# Altium project Programmable_Current_Load.PrjPcb (part 1 of 2)
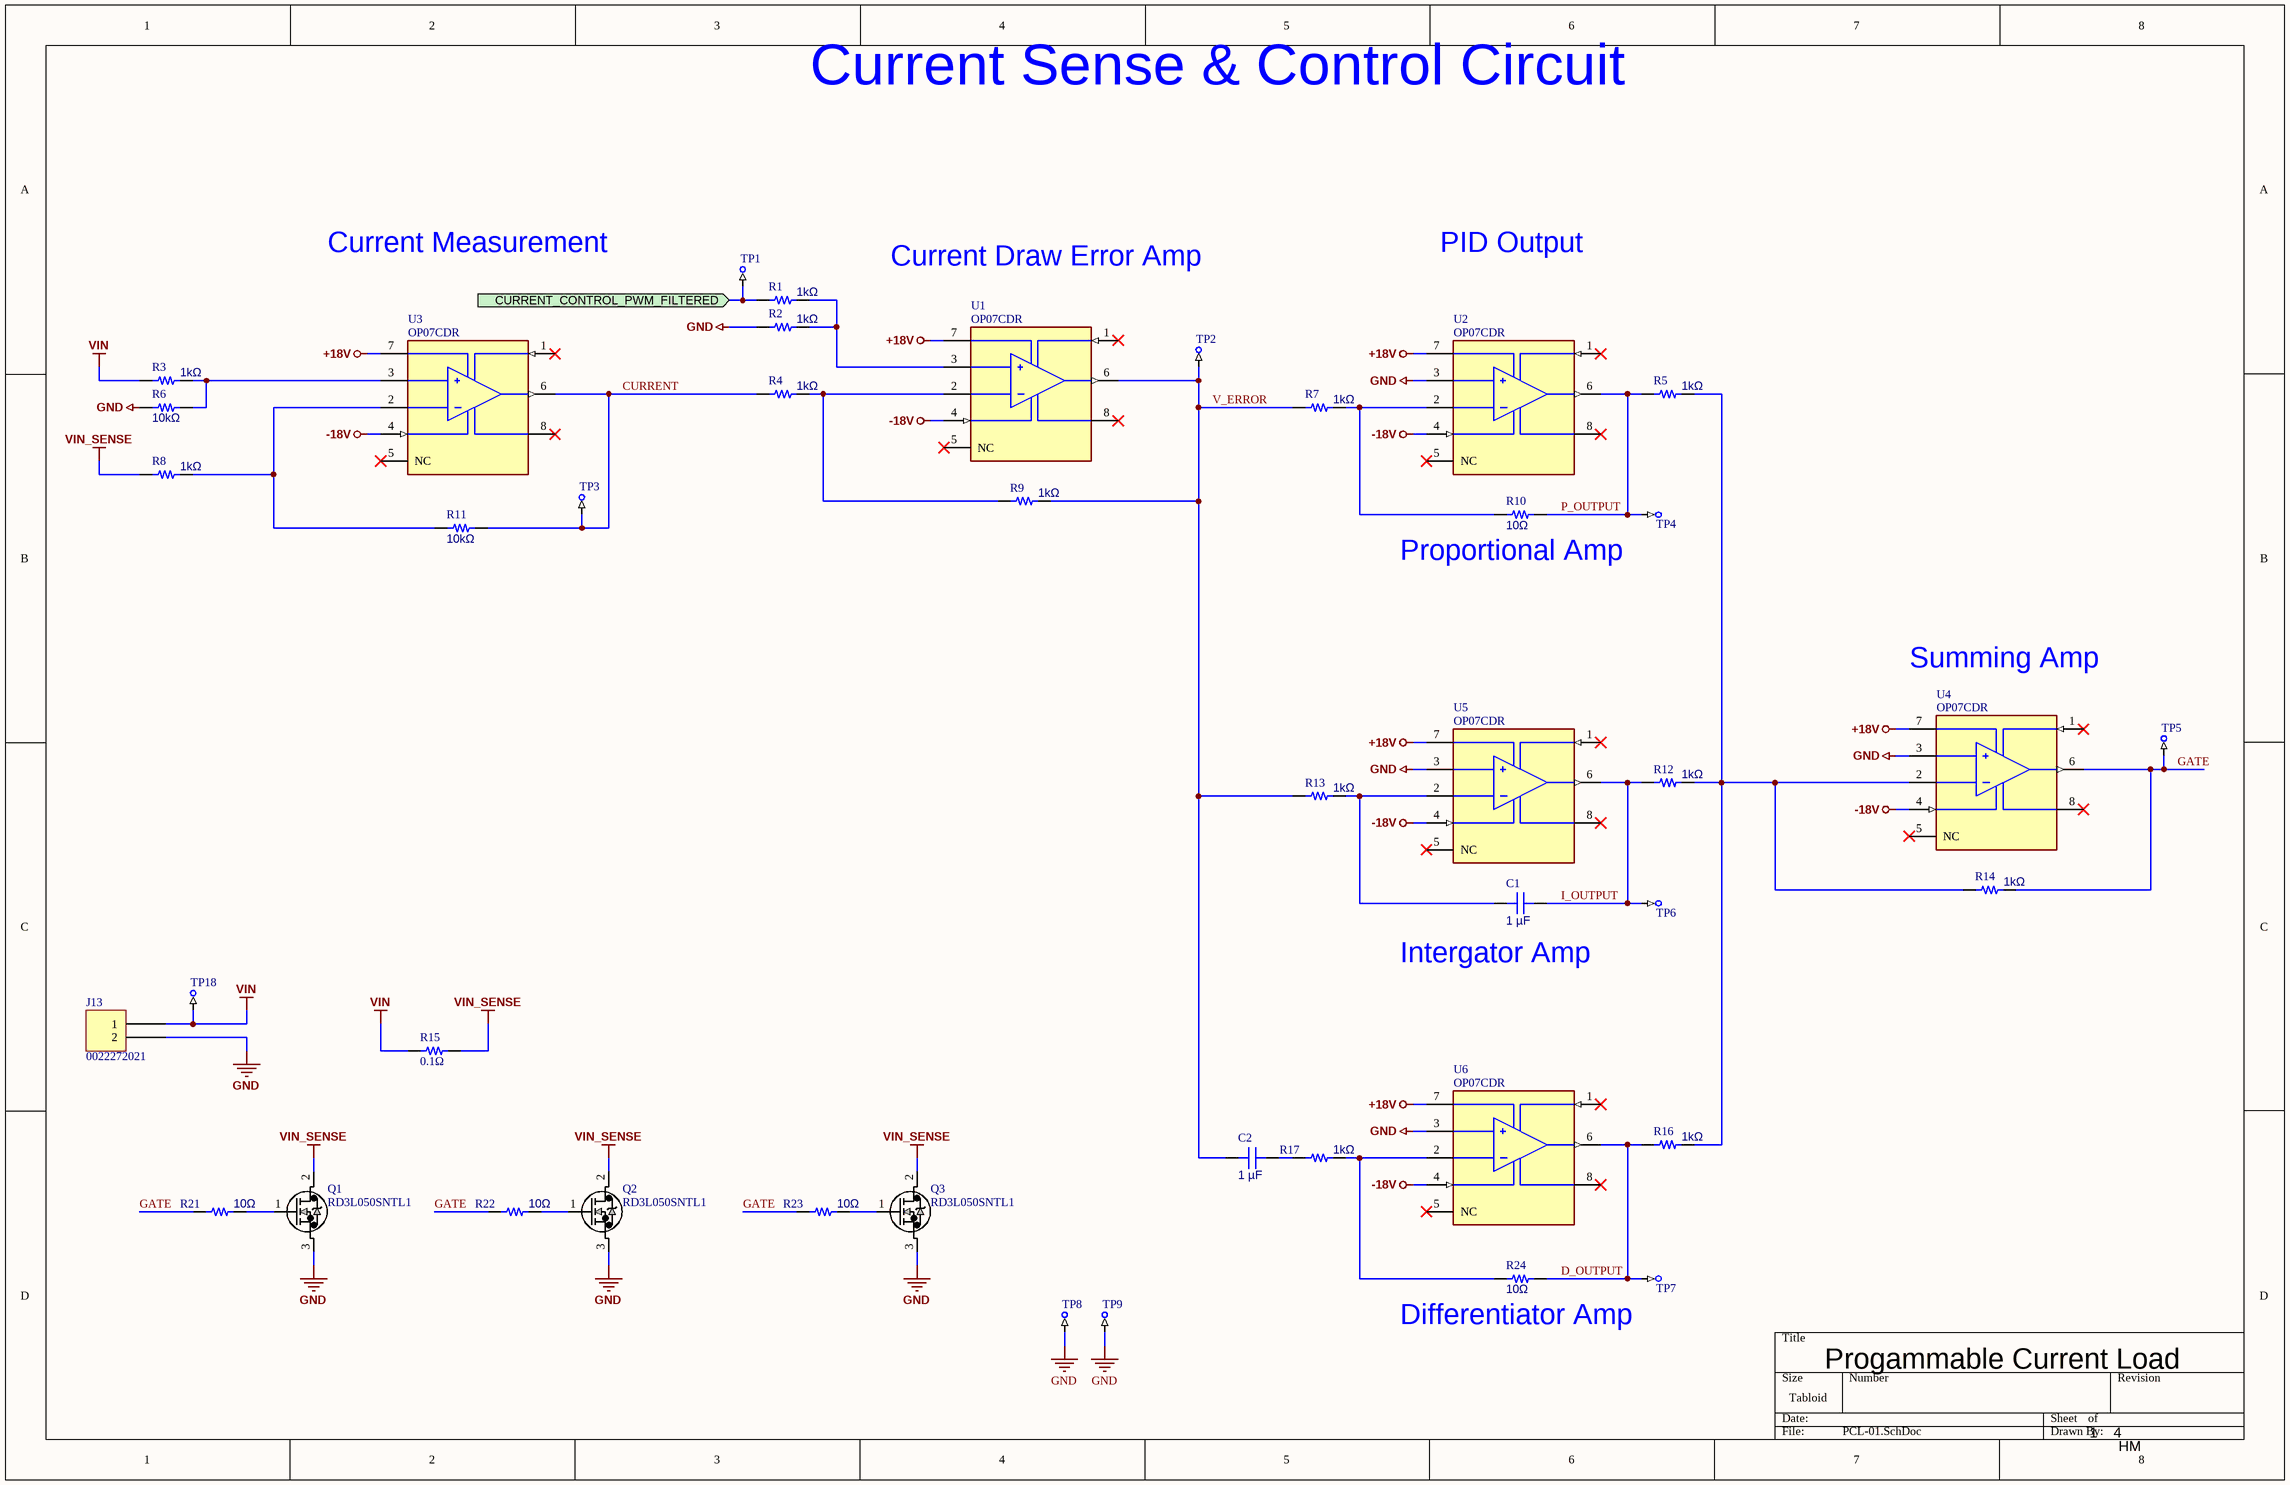
[diagram p0: PCL-01.SchDoc]
4 sheets, 153 parts. Net scope: flat (ports and power ports of the same name join across sheets).
Board file: PCL.PcbDoc
Sheets:
  PCL-01.SchDoc
  PCL-02.SchDoc
  PCL-03.SchDoc
  PCL-04.SchDoc

## Sheet PCL-01.SchDoc
size Tabloid; SheetNumber: 1; SheetTotal: 4

### Parts
C1  1 µF  [CAP 0805_2012]
C2  1 µF  [CAP 0805_2012]
J13  0022272021  [MOLEX KK 0022272021]
Q1  RD3L050SNTL1  [TRANS_RD3H045S_ROM]
Q2  RD3L050SNTL1  [TRANS_RD3H045S_ROM]
Q3  RD3L050SNTL1  [TRANS_RD3H045S_ROM]
R1  1kΩ  [RES 0805_2012]
R2  1kΩ  [RES 0805_2012]
R3  1kΩ  [RES 0805_2012]
R4  1kΩ  [RES 0805_2012]
R5  1kΩ  [RES 0805_2012]
R6  10kΩ  [RES 0805_2012]
R7  1kΩ  [RES 0805_2012]
R8  1kΩ  [RES 0805_2012]
R9  1kΩ  [RES 0805_2012]
R10  10Ω  [RES 0805_2012]
R11  10kΩ  [RES 0805_2012]
R12  1kΩ  [RES 0805_2012]
R13  1kΩ  [RES 0805_2012]
R14  1kΩ  [RES 0805_2012]
R15  0.1Ω  [RES 2512_6432]
R16  1kΩ  [RES 0805_2012]
R17  1kΩ  [RES 0805_2012]
R21  10Ω  [RES 0603_1608]
R22  10Ω  [RES 0603_1608]
R23  10Ω  [RES 0603_1608]
R24  10Ω  [RES 0805_2012]
TP1  5016  [KEYSTONE-5016_V]  (value not drawn)
TP2  5016  [KEYSTONE-5016_V]  (value not drawn)
TP3  5016  [KEYSTONE-5016_V]  (value not drawn)
TP4  5016  [KEYSTONE-5016_V]  (value not drawn)
TP5  5016  [KEYSTONE-5016_V]  (value not drawn)
TP6  5016  [KEYSTONE-5016_V]  (value not drawn)
TP7  5016  [KEYSTONE-5016_V]  (value not drawn)
TP8  5016  [KEYSTONE-5016_V]  (value not drawn)
TP9  5016  [KEYSTONE-5016_V]  (value not drawn)
TP18  5016  [KEYSTONE-5016_V]  (value not drawn)
U1  OP07CDR  [FP-D0008A-MFG]
U2  OP07CDR  [FP-D0008A-MFG]
U3  OP07CDR  [FP-D0008A-MFG]
U4  OP07CDR  [FP-D0008A-MFG]
U5  OP07CDR  [FP-D0008A-MFG]
U6  OP07CDR  [FP-D0008A-MFG]

### Ports
CURRENT_CONTROL_PWM_FILTERED (in, see PCL-02[5D])

### Nets
+18V: U1.7(VCC+) U2.7(VCC+) U3.7(VCC+) U4.7(VCC+) U5.7(VCC+) U6.7(VCC+)
-18V: U1.4(VCC-) U2.4(VCC-) U3.4(VCC-) U4.4(VCC-) U5.4(VCC-) U6.4(VCC-)
GND: J13.2 Q1.3 Q2.3 Q3.3 R2.1 R6.1 TP8.1 TP9.1 U2.3(IN+) U4.3(IN+) U5.3(IN+) U6.3(IN+)
VIN: J13.1 R3.1 R15.2 TP18.1
VIN_SENSE: Q1.2 Q2.2 Q3.2 R8.1 R15.1
CURRENT: R4.1 R11.2 TP3.1 U3.6(OUT)
D_OUTPUT: R16.1 R24.2 TP7.1 U6.6(OUT)
GATE: R14.2 R21.1 R22.1 R23.1 TP5.1 U4.6(OUT)
I_OUTPUT: C1.2 R12.1 TP6.1 U5.6(OUT)
P_OUTPUT: R5.1 R10.2 TP4.1 U2.6(OUT)
V_ERROR: C2.1 R7.1 R9.2 R13.1 TP2.1 U1.6(OUT)
NetC1_1: C1.1 R13.2 U5.2(IN-)
NetC2_2: C2.2 R17.1
NetQ1_1: Q1.1 R21.2
NetQ2_1: Q2.1 R22.2
NetQ3_1: Q3.1 R23.2
NetR1_1: R1.1 TP1.1 ; port CURRENT_CONTROL_PWM_FILTERED
NetR1_2: R1.2 R2.2 U1.3(IN+)
NetR3_2: R3.2 R6.2 U3.3(IN+)
NetR4_2: R4.2 R9.1 U1.2(IN-)
NetR5_2: R5.2 R12.2 R14.1 R16.2 U4.2(IN-)
NetR7_2: R7.2 R10.1 U2.2(IN-)
NetR8_2: R8.2 R11.1 U3.2(IN-)
NetR17_2: R17.2 R24.1 U6.2(IN-)

Not connected (* = marked no-connect by the designer): U1 1(OFFSET_N1)* 5(NC)* 8*; U2 1(OFFSET_N1)* 5(NC)* 8*; U3 1(OFFSET_N1)* 5(NC)* 8*; U4 1(OFFSET_N1)* 5(NC)* 8*; U5 1(OFFSET_N1)* 5(NC)* 8*; U6 1(OFFSET_N1)* 5(NC)* 8*

### Notes on the sheet
- Current Sense & Control Circuit
- Current Measurement
- Current Draw Error Amp
- PID Output
- Proportional Amp
- Summing Amp
- (near C1) Intergator Amp
- Differentiator Amp
- Progammable Current Load
- 1
- 4
- HM

### Library data of the parts
C1 C2 = 0805X105K500CT: CAP CER 1UF 50V X5R 0805; manufacturer: Walsin Technology Corporation; Tolerance: ±10%; Part Number: 0805X105K500CT; Capacitance: 1 µF; Applications: General Purpose; componentlink1description: Datasheet; componentlink1url: https://www.passivecomponent.com/wp-content/uploads/datasheet/WTC_MLCC_General_Purpose.pdf; componentlink2description: DigiKey Link; componentlink2url: https://www.digikey.com/en/products/detail/walsin-technology-corporation/0805X105K500CT/15978747; Device Package: 0805 (2012 Metric); lastupdated: 2026-04-06 7:30:03 PM; Lifecycle Status: Active; Minimum Order: 1; Mounting Type: Surface Mount, MLCC; Operating Temperature: -55°C ~ 85°C; Package / Case: 0805 (2012 Metric); packaging: TapeAndReel; partid: 55928; price: 0.01; series: -; Size / Dimension: 0.079" L x 0.049" W (2.00mm x 1.25mm); Supplier 1: DigiKey; Supplier Part Number 1: 1292-0805X105K500CT-ND; Temperature Coefficient: X5R; Thickness (Max): 0.057" (1.45mm); value: 1 µF; Voltage - Rated: 50V
J13 = 0022272021: CONN HEADER VERT 2POS 2.54MM; Manufacturer: Molex; Contact Length - Mating: 0.295" (7.49mm); Contact Length - Post: 0.140" (3.56mm); Material Flammability Rating: UL94 V-0; Number of Positions: 2; Number of Positions Loaded: All; Overall Contact Length: 0.560" (14.22mm); Pitch - Mating: 0.100" (2.54mm); Shrouding: Shrouded - 1 Wall; Style: Board to Cable/Wire; Part Number: 0022272021; ComponentLink1Description: Datasheet; ComponentLink1URL: https://www.molex.com/pdm_docs/sd/022272021_sd.pdf; ComponentLink2Description: DigiKey Link; ComponentLink2URL: http://digikey.com/product-detail/en/molex/0022272021/WM4111-ND/1130577; Connector Type: Header; Contact Finish - Mating: Tin; Contact Finish - Post: Tin; Contact Finish Thickness - Mating: 100.0µin (2.54µm); Contact Material: Brass; Contact Shape: Square; Contact Type: Male Pin; Fastening Type: Friction Lock; Insulation Color: Natural; Insulation Height: 0.461" (11.70mm); Insulation Material: Polyamide (PA), Nylon; LastUpdated: 2020-01-12 11:51:43 PM; Lifecycle Status: Active; Minimum Order: 1; Mounting Type: Through Hole; Number of Rows: 1; Packaging: Bulk; PartId: 76; Part Status: Active; Price: 0.27; Series: KK 6410; Supplier 1: DigiKey; Supplier Part Number 1: WM4111-ND; Termination: Solder
Q1-Q3 = RD3L050SNTL1: Description; Manufacturer_Name: ROHM Semiconductor; Copyright: Copyright (C) 2026 Ultra Librarian. All rights reserved.; Manufacturer_Part_Number: RD3L050SNTL1
R1-R5 R7-R9 R12-R14 R16 R17 = 1-2176092-8: RES SMD 1K OHM 0.1% 1/4W 0805; Manufacturer: TE Connectivity Passive Product; Power (Watts): 0.25W, 1/4W; Resistance: 1 kOhms; Temperature Coefficient: ±25ppm/°C; Part Number: 1-2176092-8; Value: 1kΩ; ComponentLink1Description: Datasheet; ComponentLink1URL: https://www.te.com/commerce/DocumentDelivery/DDEController?Action=srchrtrv&DocNm=1773272&DocType=DS&DocLang=English; ComponentLink2Description: DigiKey Link; ComponentLink2URL: https://www.digikey.com/en/products/detail/te-connectivity-passive-product/1-2176092-8/4034011; Composition: Thin Film; Device Package: 0805 (2012 Metric); Height - Seated (Max): 0.026" (0.65mm); LastUpdated: 2026-04-05 8:11:23 PM; Lifecycle Status: Active; Minimum Order: 1; Number of Terminations: 2; Operating Temperature: -55°C ~ 155°C; Package / Case: 0805 (2012 Metric); Packaging: TapeAndReel; PartId: 28484; Part Status: Active; Price: 0.13; Series: RP73P, Holsworthy; Size / Dimension: 0.079" L x 0.049" W (2.00mm x 1.25mm); Supplier 1: DigiKey; Supplier Part Number 1: A110543CT-ND; Supplier Device Package: 0805; Tolerance: ±0.1%
R6 R11 = RNCS0805BKE10K0: RES 10K OHM 0.1% 1/10W 0805; Manufacturer: Stackpole Electronics Inc; Power (Watts): 0.1W, 1/10W; Resistance: 10 kOhms; Temperature Coefficient: ±25ppm/°C; Part Number: RNCS0805BKE10K0; Value: 10kΩ; ComponentLink1Description: Datasheet; ComponentLink1URL: https://www.seielect.com/catalog/sei-rncs_rnch.pdf; ComponentLink2Description: DigiKey Link; ComponentLink2URL: https://www.digikey.com/en/products/detail/stackpole-electronics-inc/RNCS0805BKE10K0/1800067; Composition: Thin Film; Device Package: 0805 (2012 Metric); Features: Anti-Corrosive, Automotive AEC-Q200, Moisture Resistant; Height - Seated (Max): 0.026" (0.65mm); LastUpdated: 2026-04-05 8:11:26 PM; Lifecycle Status: Active; Minimum Order: 1; Number of Terminations: 2; Operating Temperature: -55°C ~ 155°C; Package / Case: 0805 (2012 Metric); Packaging: TapeAndReel; PartId: 27713; Part Status: Active; Price: 0.07; Ratings: AEC-Q200; Series: RNCS; Size / Dimension: 0.079" L x 0.049" W (2.00mm x 1.25mm); Supplier 1: DigiKey; Supplier Part Number 1: RNCS0805BKE10K0CT-ND; Supplier Device Package: 0805; Tolerance: ±0.1%
R10 R24 = RNCS0805BKE10R0: RES 10 OHM 0.1% 1/10W 0805; Manufacturer: Stackpole Electronics Inc; Power (Watts): 0.1W, 1/10W; Resistance: 10 Ohms; Temperature Coefficient: ±25ppm/°C; Part Number: RNCS0805BKE10R0; Value: 10Ω; ComponentLink1Description: Datasheet; ComponentLink1URL: https://www.seielect.com/catalog/sei-rncs_rnch.pdf; ComponentLink2Description: DigiKey Link; ComponentLink2URL: https://www.digikey.com/en/products/detail/stackpole-electronics-inc/RNCS0805BKE10R0/1800064; Composition: Thin Film; Device Package: 0805 (2012 Metric); Features: Anti-Corrosive, Automotive AEC-Q200, Moisture Resistant; Height - Seated (Max): 0.026" (0.65mm); LastUpdated: 2026-04-05 8:11:26 PM; Lifecycle Status: Active; Minimum Order: 1; Number of Terminations: 2; Operating Temperature: -55°C ~ 155°C; Package / Case: 0805 (2012 Metric); Packaging: TapeAndReel; PartId: 27711; Part Status: Active; Price: 0.07; Ratings: AEC-Q200; Series: RNCS; Size / Dimension: 0.079" L x 0.049" W (2.00mm x 1.25mm); Supplier 1: DigiKey; Supplier Part Number 1: RNCS0805BKE10R0CT-ND; Supplier Device Package: 0805; Tolerance: ±0.1%
R15 = CSRL3-0R1F8: RES 0.1 OHM 1% 3W 2512; manufacturer: Riedon; Resistance: 100 mOhms; Temperature Coefficient: ±75ppm/°C; value: 100 mOhms; Part Number: CSRL3-0R1F8; componentlink1description: Datasheet; componentlink1url: https://riedon.com/media/pdf/CSRL.pdf; componentlink2description: DigiKey Link; componentlink2url: http://digikey.com/product-detail/en/riedon/CSRL3-0R1F8/696-1842-1-ND/9666106; Composition: Metal Element; Device Package: 2512 (6432 Metric); Features: Current Sense, Non-Inductive; Height - Seated (Max): 0.035" (0.90mm); lastupdated: 2020-09-02 1:26:50 AM; Lifecycle Status: Active; Minimum Order: 1; Number of Terminations: 2; Operating Temperature: -55°C ~ 170°C; Package / Case: 2512 (6432 Metric); packaging: TapeAndReel; Part Status: Active; Power (Watts): 3W; price: 0.11; series: CSRL; Size / Dimension: 0.252" L x 0.126" W (6.40mm x 3.20mm); Supplier 1: DigiKey; Supplier Part Number 1: 696-1842-1-ND; Supplier Device Package: 2512; Tolerance: ±1%
R21-R23 = ESR03EZPF10R0: RES SMD 10 OHM 1% 1/4W 0603; Manufacturer: Rohm Semiconductor; Power (Watts): 0.25W, 1/4W; Resistance: 10 Ohms; Temperature Coefficient: ±100ppm/°C; Part Number: ESR03EZPF10R0; Value: 10Ω; ComponentLink1Description: Datasheet; ComponentLink1URL: https://www.rohm.com/datasheet/ESR01MZPF/esr-e; ComponentLink2Description: DigiKey Link; ComponentLink2URL: https://www.digikey.com/en/products/detail/rohm-semiconductor/ESR03EZPF10R0/1983431; Composition: Thick Film; Device Package: 0603 (1608 Metric); Features: Automotive AEC-Q200, Pulse Withstanding; Height - Seated (Max): 0.022" (0.55mm); LastUpdated: 2024-02-09 8:43:34 PM; Lifecycle Status: Active; Minimum Order: 1; Number of Terminations: 2; Operating Temperature: -55°C ~ 155°C; Package / Case: 0603 (1608 Metric); Packaging: TapeAndReel; PartId: 5471; Part Status: Active; Price: 0.02; Ratings: AEC-Q200; Series: ESR; Size / Dimension: 0.063" L x 0.031" W (1.60mm x 0.80mm); Supplier 1: DigiKey; Supplier Part Number 1: RHM10.0ADCT-ND; Supplier Device Package: 0603; Tolerance: ±1%
TP1-TP9 TP18 = CMP-2000-05178-1: Test Point, 1-Pin SMT, RoHS, Tape and Reel; Manufacturer: Keystone; Other Names: 5016KDKR; Featured Product: SurfaceMountTestPoints / 5019MiniatureSurfaceMountTestPoint; Online Catalog: SurfaceMountTestPoints; Catalog Drawings: 5016Top / 5016Side / 5016Front; Packaging: Digi-Reel; RoHS Information: RoHSComplianceStatement; Package Reference: 5016; Mounting Type: SurfaceMount; Type: PCTestPoint,Compact; Manufacturer URL: http://www.keyelco.com/; Standard Package: 1; Package Description: 1-Pin Test Point, Body 3.81 x 2.04 mm; Category: TestandMeasurement; Terminal: 0.015"(0.38mm)PhosphorBronze,SilverPlated; Datasheet URL: https://ciiva.com/datasheet-click-2917613?src=ciiva&sig=4a4e90f; Datasheet Version: Rev. D, 03/2014; Family: TestPoints; Material: PhosphorBronze
U1-U6 = CMP-0015-00070-3: IC OPAMP GP 1 CIRCUIT 8SOIC; Number of Circuits: 1; Dual Supply Voltage: 9V; Max I/O Voltage: 150uV; Max Dual Supply Voltage: 18V; Nominal Supply Current: 5mA; Bandwidth: 600kHz; Slew Rate: 0.3V/µs; Input Bias Current: 7nA; Min Dual Supply Voltage: 3V; Common Mode Rejection Ratio: 100dB; Voltage Gain: 112.04dB; Packaging: Tape and Reel; Min Operating Temperature: 0°C; REACH SVHC: No SVHC; Operating Supply Voltage: 18V; Package Quantity: 1; Number of Channels: 1; Number of Pins: 8; Number of Elements: 1; Lead Free: Lead Free; Gain Bandwidth Product: 600kHz; Nominal Gain Bandwidth Product: 600kHz; Unity Gain Bandwidth Product: 600kHz; Width: 3.91mm; Case/Package: D; Radiation Hardening: No; Input Offset Voltage (Vos): 150uV; Height: 1.58mm; Length: 4.9mm; Max Operating Temperature: 70°C; Number of Amplifiers: 1

## Sheet PCL-02.SchDoc
size Tabloid; SheetNumber: 2; SheetTotal: 4
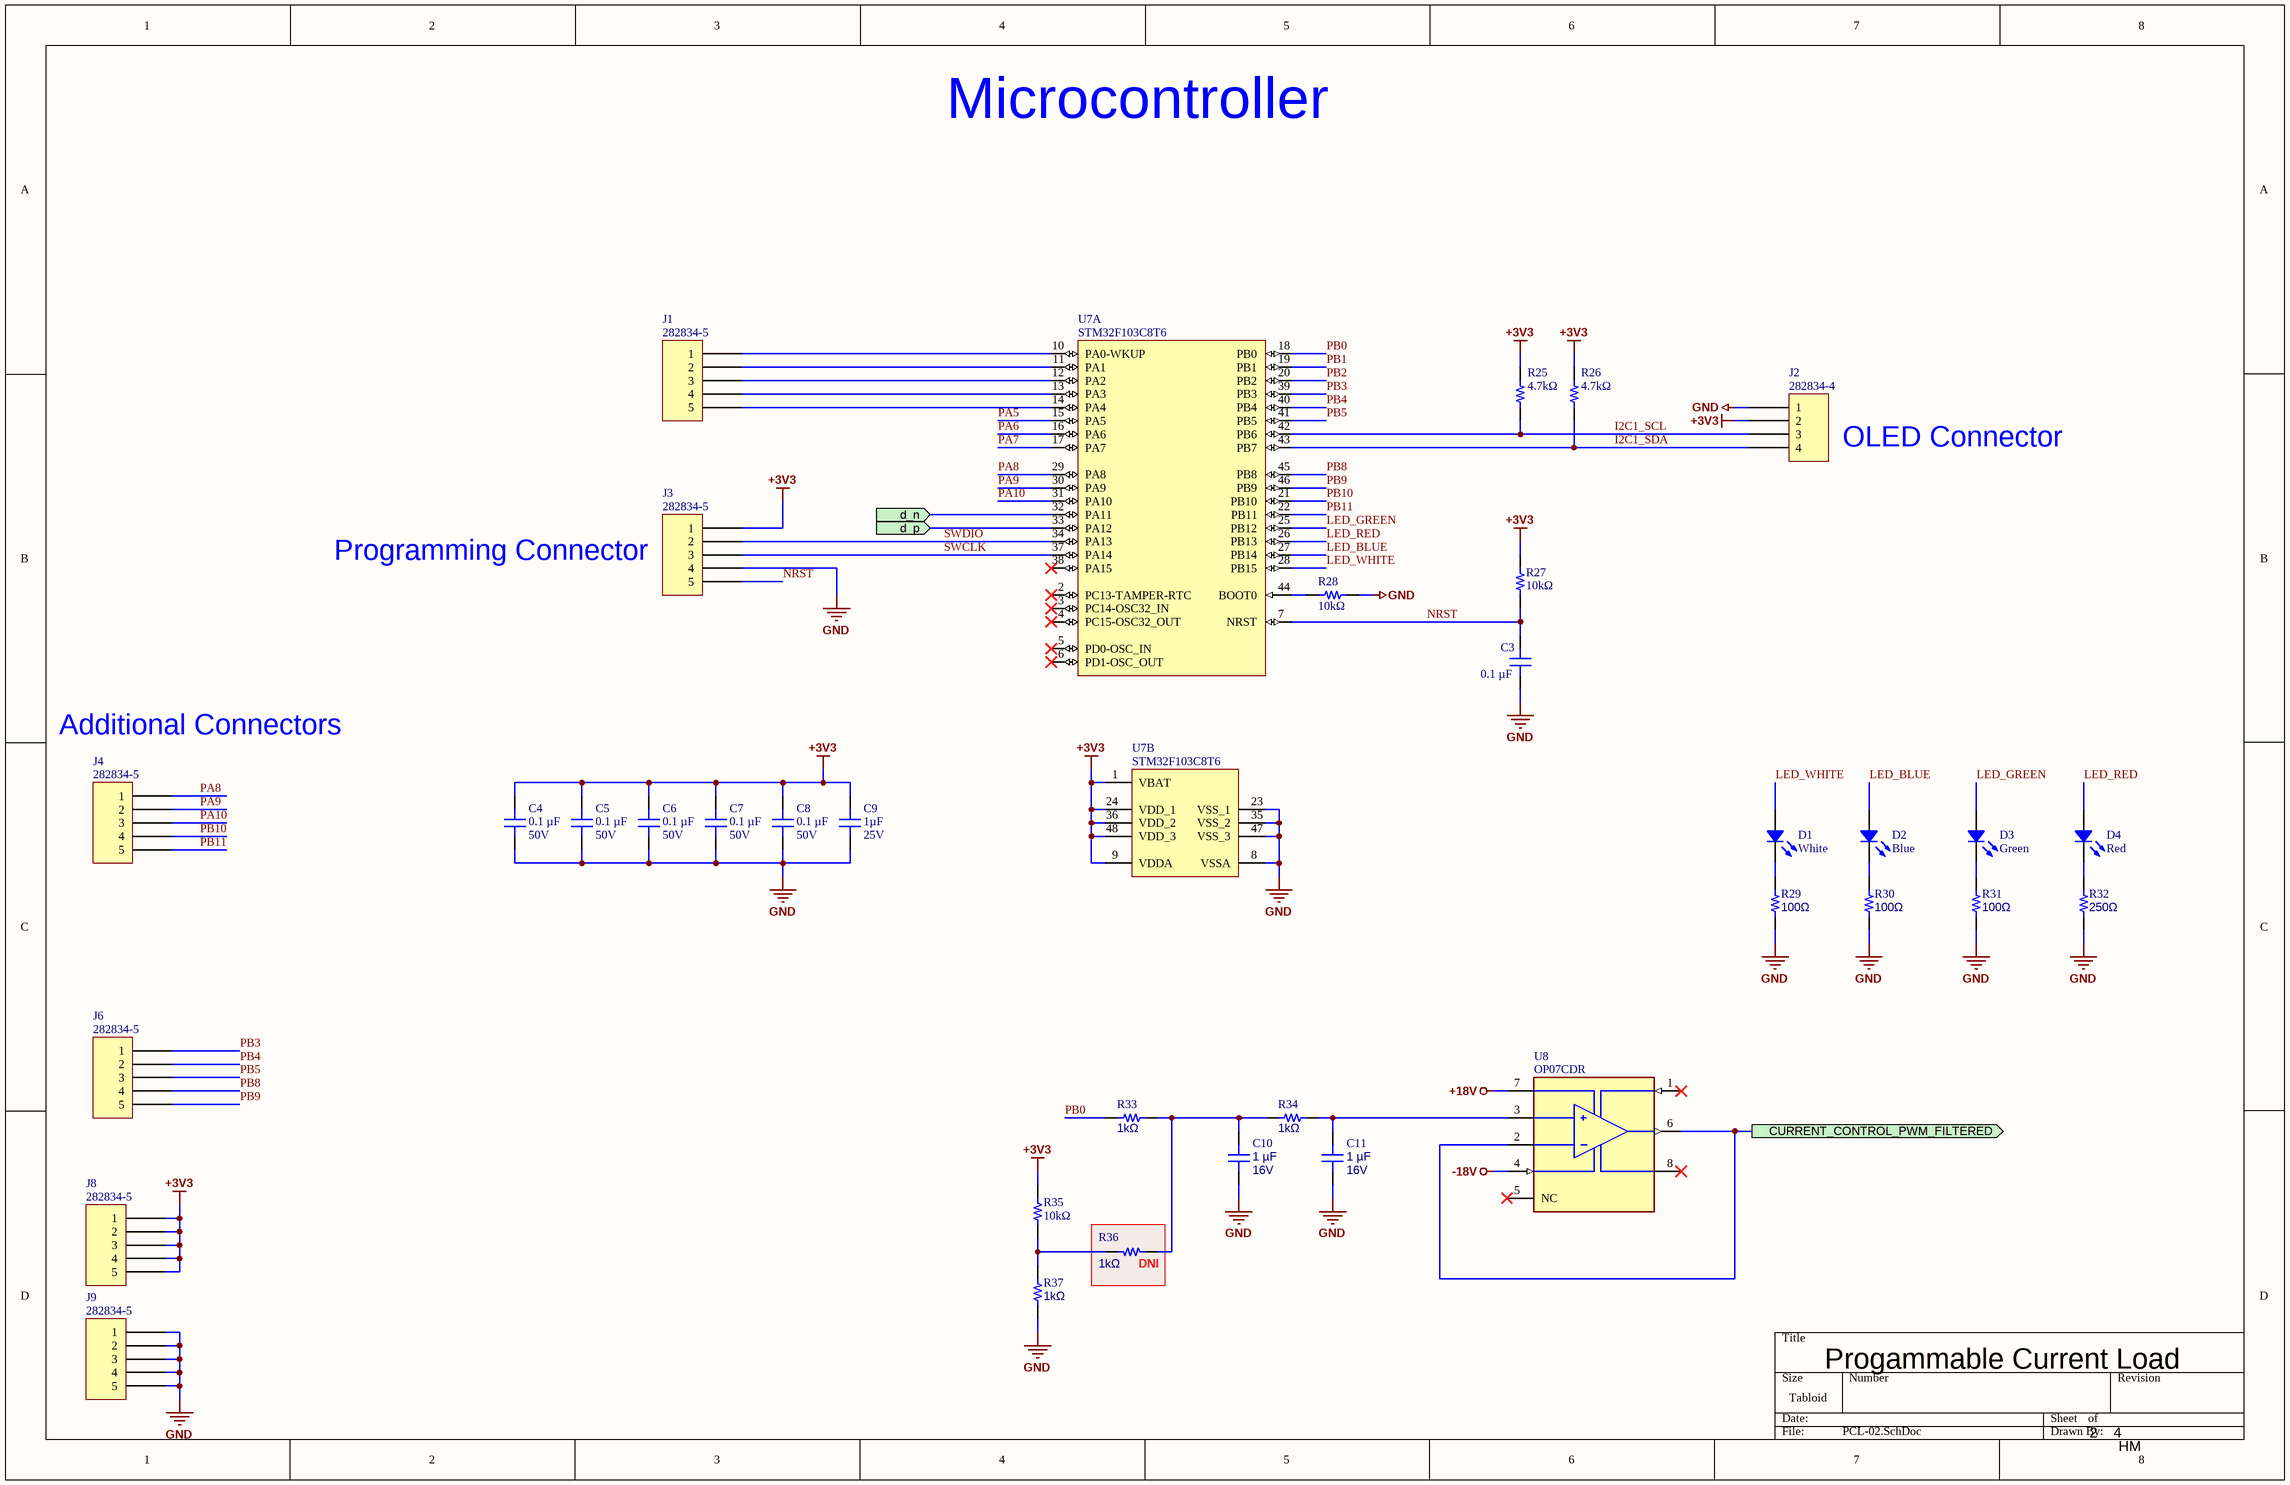
[diagram p1: PCL-02.SchDoc]

### Parts
C3  0.1 µF  [CAP 0603_1608]
C4  Voltage - Rated: 50V  [CAP 0603_1608]  (hidden comment: 0.1 µF)
C5  Voltage - Rated: 50V  [CAP 0603_1608]  (hidden comment: 0.1 µF)
C6  Voltage - Rated: 50V  [CAP 0603_1608]  (hidden comment: 0.1 µF)
C7  Voltage - Rated: 50V  [CAP 0603_1608]  (hidden comment: 0.1 µF)
C8  Voltage - Rated: 50V  [CAP 0603_1608]  (hidden comment: 0.1 µF)
C9  Voltage - Rated: 25V  [CAP 0805_2012]  (hidden comment: 1µF)
C10  Voltage - Rated: 16V  [CAP 0603_1608]  (hidden comment: 1 µF)
C11  Voltage - Rated: 16V  [CAP 0603_1608]  (hidden comment: 1 µF)
D1  White  [LED 0603_1608]
D2  Blue  [LED 0603_1608 BLUE]
D3  Green  [LED 0603_1608 GREEN]
D4  Red  [LED 0603_1608 RED]
J1  282834-5  [TE 282834-5]
J2  282834-4  [TE 282834-4]
J3  282834-5  [TE 282834-5]
J4  282834-5  [TE 282834-5]
J6  282834-5  [TE 282834-5]
J8  282834-5  [TE 282834-5]
J9  282834-5  [TE 282834-5]
R25  4.7kΩ  [RES 0603_1608]
R26  4.7kΩ  [RES 0603_1608]
R27  10kΩ  [RES 0603_1608]
R28  10kΩ  [RES 0603_1608]
R29  100Ω  [RES 0603_1608]
R30  100Ω  [RES 0603_1608]
R31  100Ω  [RES 0603_1608]
R32  250Ω  [RES 0603_1608]
R33  1kΩ  [RES 0603_1608]
R34  1kΩ  [RES 0603_1608]
R35  10kΩ  [RES 0603_1608]
R36  1kΩ  [RES 0603_1608]
R37  1kΩ  [RES 0603_1608]
U7  STM32F103C8T6  [STM-LQFP48_L]  (parts A,B of 2)
U8  OP07CDR  [FP-D0008A-MFG]

### Blocks framed on the sheet
DNI: R36

### Ports
CURRENT_CONTROL_PWM_FILTERED (out, see PCL-01[2A]), d_n (in, see PCL-04[6B]), d_p (in, see PCL-04[6B])

### Nets
+3V3: C4.2 C5.2 C6.2 C7.2 C8.2 C9.2 J2.2 J3.1 J8.1 J8.2 J8.3 J8.4 J8.5 R25.2 R26.2 R27.2 R35.2 U7.1(VBAT) U7.9(VDDA) U7.24(VDD_1) U7.36(VDD_2) U7.48(VDD_3)
+18V: U8.7(VCC+)
-18V: U8.4(VCC-)
GND: C3.1 C4.1 C5.1 C6.1 C7.1 C8.1 C9.1 C10.1 C11.1 J2.1 J3.4 J9.1 J9.2 J9.3 J9.4 J9.5 R28.1 R29.1 R30.1 R31.1 R32.1 R37.1 U7.8(VSSA) U7.23(VSS_1) U7.35(VSS_2) U7.47(VSS_3)
d_n: U7.32(PA11) ; port d_n
d_p: U7.33(PA12) ; port d_p
I2C1_SCL: J2.3 R25.1 U7.42(PB6)
I2C1_SDA: J2.4 R26.1 U7.43(PB7)
LED_BLUE: D2.1 U7.27(PB14)
LED_GREEN: D3.1 U7.25(PB12)
LED_RED: D4.1 U7.26(PB13)
LED_WHITE: D1.1 U7.28(PB15)
NRST: C3.2 J3.5 R27.1 U7.7(NRST)
PA5: U7.15(PA5)
PA6: U7.16(PA6)
PA7: U7.17(PA7)
PA8: J4.1 U7.29(PA8)
PA9: J4.2 U7.30(PA9)
PA10: J4.3 U7.31(PA10)
PB0: R33.1 U7.18(PB0)
PB1: U7.19(PB1)
PB2: U7.20(PB2)
PB3: J6.1 U7.39(PB3)
PB4: J6.2 U7.40(PB4)
PB5: J6.3 U7.41(PB5)
PB8: J6.4 U7.45(PB8)
PB9: J6.5 U7.46(PB9)
PB10: J4.4 U7.21(PB10)
PB11: J4.5 U7.22(PB11)
SWCLK: J3.3 U7.37(PA14)
SWDIO: J3.2 U7.34(PA13)
NetC10_2: C10.2 R33.2 R34.1 R36.2
NetC11_2: C11.2 R34.2 U8.3(IN+)
NetD1_2: D1.2 R29.2
NetD2_2: D2.2 R30.2
NetD3_2: D3.2 R31.2
NetD4_2: D4.2 R32.2
NetJ1_1: J1.1 U7.10(PA0-WKUP)
NetJ1_2: J1.2 U7.11(PA1)
NetJ1_3: J1.3 U7.12(PA2)
NetJ1_4: J1.4 U7.13(PA3)
NetJ1_5: J1.5 U7.14(PA4)
NetR1_1: U8.2(IN-) U8.6(OUT) ; port CURRENT_CONTROL_PWM_FILTERED
NetR28_2: R28.2 U7.44(BOOT0)
NetR35_1: R35.1 R36.1 R37.2

Not connected (* = marked no-connect by the designer): U7 2(PC13-TAMPER-RTC)* 3(PC14-OSC32_IN)* 4(PC15-OSC32_OUT)* 5(PD0-OSC_IN)* 6(PD1-OSC_OUT)* 38(PA15)*; U8 1(OFFSET_N1)* 5(NC)* 8*

### Notes on the sheet
- Microcontroller
- OLED Connector
- Programming Connector
- Additional Connectors
- Progammable Current Load
- 2
- 4
- HM

### Library data of the parts
C3-C8 = C0603C104K5RAC7411: CAP CER 0.1UF 50V X7R 0603; manufacturer: KEMET; Tolerance: ±10%; Part Number: C0603C104K5RAC7411; Capacitance: 0.1 µF; Applications: Bypass, Decoupling; componentlink1description: Datasheet; componentlink1url: https://api.kemet.com/component-edge/download/datasheet/C0603C104K5RAC7411.pdf; componentlink2description: DigiKey Link; componentlink2url: https://www.digikey.com/en/products/detail/kemet/C0603C104K5RAC7411/3317013; Device Package: 0603 (1608 Metric); lastupdated: 2026-04-06 7:23:52 PM; Lifecycle Status: Active; Minimum Order: 1; Mounting Type: Surface Mount, MLCC; Operating Temperature: -55°C ~ 125°C; Package / Case: 0603 (1608 Metric); packaging: TapeAndReel; partid: 2233; Part Status: Active; price: 0.01; series: SMD Comm X7R; Size / Dimension: 0.063" L x 0.031" W (1.60mm x 0.80mm); Supplier 1: DigiKey; Supplier Part Number 1: 399-C0603C104K5RAC7411CT-ND; Temperature Coefficient: X7R; Thickness (Max): 0.035" (0.90mm); value: 0.1 µF
  C3: Voltage - Rated: 50V
C9 = 08053D105KAT2A: CAP CER 1UF 25V X5R 0805; manufacturer: AVX Corporation; Tolerance: ±10%; Part Number: 08053D105KAT2A; Capacitance: 1µF; Applications: General Purpose; componentlink1description: Datasheet; componentlink1url: http://datasheets.avx.com/cx5r.pdf; componentlink2description: DigiKey Link; componentlink2url: http://digikey.com/product-detail/en/avx-corporation/08053D105KAT2A/478-1409-1-ND/564441; Device Package: 0805 (2012 Metric); lastupdated: 2020-09-02 1:04:40 AM; Lifecycle Status: Active; Minimum Order: 1; Mounting Type: Surface Mount, MLCC; Operating Temperature: -55°C ~ 85°C; Package / Case: 0805 (2012 Metric); packaging: TapeAndReel; partid: 3127; Part Status: Active; price: 0.12; series: -; Size / Dimension: 0.079" L x 0.049" W (2.01mm x 1.25mm); Supplier 1: DigiKey; Supplier Part Number 1: 478-1409-1-ND; Temperature Coefficient: X5R; Thickness (Max): 0.055" (1.40mm); value: 1µF
C10 C11 = C0603C105K4RACAUTO: CAP CER 1UF 16V X7R 0603; manufacturer: KEMET; Tolerance: ±10%; Part Number: C0603C105K4RACAUTO; Capacitance: 1 µF; Applications: Automotive, Bypass, Decoupling; componentlink1description: Datasheet; componentlink1url: https://api.kemet.com/component-edge/download/datasheet/C0603C105K4RACAUTO.pdf; componentlink2description: DigiKey Link; componentlink2url: https://www.digikey.com/en/products/detail/kemet/C0603C105K4RACAUTO/8635831; Device Package: 0603 (1608 Metric); lastupdated: 2026-04-06 7:23:53 PM; Lifecycle Status: Active; Minimum Order: 1; Mounting Type: Surface Mount, MLCC; Operating Temperature: -55°C ~ 125°C; Package / Case: 0603 (1608 Metric); packaging: TapeAndReel; partid: 2179; Part Status: Active; price: 0.02; Ratings: AEC-Q200; series: SMD Auto X7R; Size / Dimension: 0.063" L x 0.031" W (1.60mm x 0.80mm); Supplier 1: DigiKey; Supplier Part Number 1: 399-17704-1-ND; Temperature Coefficient: X7R; Thickness (Max): 0.037" (0.95mm); value: 1 µF
D1 = 5973905607F: LED WHITE 0603 SMD; Manufacturer: Dialight; Configuration: Standard; Current - Test: 5mA; Lens Color: 0.45mm; Lens Size: 1.20mm x 0.80mm; Lens Style: Rectangle with Flat Top; Viewing Angle: 130°; Voltage - Forward (Vf) (Typ): 2.925V; Part Number: 5973905607F; Color: White; ComponentLink2Description: DigiKey Link; ComponentLink2URL: https://www.digikey.com/en/products/detail/dialight/5973905607F/9385450; Device Package: 0603 (1608 Metric); Height (Max): 0.45mm; LastUpdated: 2026-04-05 8:43:50 PM; Lifecycle Status: Active; Minimum Order: 1; Mounting Type: Surface Mount; Package / Case: 0603 (1608 Metric); Packaging: TapeAndReel; PartId: 883; Part Status: Active; Price: 0.09; Series: 597; Size / Dimension: 1.60mm L x 0.80mm W; Supplier 1: DigiKey; Supplier Part Number 1: 350-4395-1-ND; Supplier Device Package: 0603; Value: White
D2 = VLMB1300-GS08: LED BLUE 0603 SMD; Manufacturer: Vishay Semiconductor Opto Division; Configuration: Standard; Current - Test: 20mA; Lens Color: 1.00mm; Lens Size: 1.10mm x 0.80mm; Lens Style: Rectangle with Flat Top; Millicandela Rating: 104mcd; Viewing Angle: 130°; Voltage - Forward (Vf) (Typ): 3.3V; Wavelength - Dominant: 470nm; Wavelength - Peak: 468nm; Part Number: VLMB1300-GS08; Color: Blue; ComponentLink1Description: Datasheet; ComponentLink1URL: http://www.vishay.com/docs/82437/vlmo1300.pdf; ComponentLink2Description: DigiKey Link; ComponentLink2URL: https://www.digikey.com/en/products/detail/vishay-semiconductor-opto-division/VLMB1300-GS08/3025494; Device Package: 0603 (1608 Metric); Height (Max): 1.00mm; LastUpdated: 2026-04-05 8:35:04 PM; Lifecycle Status: Active; Minimum Order: 1; Mounting Type: Surface Mount; Package / Case: 0603 (1608 Metric); Packaging: TapeAndReel; PartId: 785; Part Status: Active; Price: 0.06; Series: CHIPLED; Size / Dimension: 1.60mm L x 0.80mm W; Supplier 1: DigiKey; Supplier Part Number 1: VLMB1300-GS08CT-ND; Supplier Device Package: 0603; Value: Blue
D3 = SM0603GCL: LED GREEN CLEAR 0603 SMD; Manufacturer: Bivar Inc.; Configuration: Standard; Current - Test: 2mA; Lens Color: Colorless; Lens Size: 1.00mm x 0.80mm; Lens Style: Rectangle with Flat Top; Millicandela Rating: 3.6mcd; Viewing Angle: 130°; Voltage - Forward (Vf) (Typ): 1.9V; Wavelength - Dominant: 574nm; Wavelength - Peak: 575nm; Part Number: SM0603GCL; Color: Green; ComponentLink1Description: Datasheet; ComponentLink1URL: https://www.bivar.com/Files/Datasheets/SM0603GCL.pdf; ComponentLink2Description: DigiKey Link; ComponentLink2URL: https://www.digikey.com/en/products/detail/bivar-inc/SM0603GCL/3095514; Device Package: 0603 (1608 Metric); Height (Max): 0.60mm; LastUpdated: 2026-04-05 8:36:38 PM; Lens Transparency: Clear; Lifecycle Status: Active; Minimum Order: 1; Mounting Type: Surface Mount; Package / Case: 0603 (1608 Metric); Packaging: TapeAndReel; PartId: 622; Part Status: Active; Price: 0.19; Series: -; Size / Dimension: 1.60mm L x 0.80mm W; Supplier 1: DigiKey; Supplier Part Number 1: 492-2523-1-ND; Supplier Device Package: 0603; Value: Green
D4 = 5973005507F: LED RED 0603 SMD; Manufacturer: Dialight; Configuration: Standard; Current - Test: 20mA; Lens Color: 0.68mm; Lens Size: 1.20mm x 0.80mm; Lens Style: Rectangle with Flat Top; Millicandela Rating: 90mcd; Voltage - Forward (Vf) (Typ): 2V; Wavelength - Dominant: 630nm; Part Number: 5973005507F; Color: Red; ComponentLink1Description: Datasheet; ComponentLink1URL: http://www.dialightsignalsandcomponents.com/Assets/Drawings/2D_Drawings_DrawingDetailedSpec/NewDrawings/18369A.pdf; ComponentLink2Description: DigiKey Link; ComponentLink2URL: https://www.digikey.com/en/products/detail/dialight/5973005507F/9385429; Device Package: 0603 (1608 Metric); Height (Max): 0.68mm; LastUpdated: 2026-04-05 8:38:00 PM; Lifecycle Status: Active; Minimum Order: 1; Mounting Type: Surface Mount; Package / Case: 0603 (1608 Metric); Packaging: TapeAndReel; PartId: 378; Part Status: Active; Price: 0.09; Series: 597; Size / Dimension: 1.60mm L x 0.80mm W; Supplier 1: DigiKey; Supplier Part Number 1: 350-4374-1-ND; Supplier Device Package: 0603; Value: Red
J1 J3 J4 J6 J8 J9 = 282834-5: TERM BLK 5P SIDE ENT 2.54MM PCB; Manufacturer: TE Connectivity AMP Connectors; Current: 10A; Mating Orientation: Horizontal with Board; Number of Levels: 1; Pitch: 0.100" (2.54mm); Positions Per Level: 5; Voltage: 150V; Wire Gauge: 16-30 AWG; Wire Termination: Screw - Rising Cage Clamp; Part Number: 282834-5; Color: Green; ComponentLink1Description: Datasheet; ComponentLink1URL: https://www.te.com/commerce/DocumentDelivery/DDEController?Action=srchrtrv&DocNm=282834&DocType=Customer+Drawing&DocLang=English; ComponentLink2Description: DigiKey Link; ComponentLink2URL: http://digikey.com/product-detail/en/te-connectivity-amp-connectors/282834-5/A98336-ND/1153266; LastUpdated: 2020-01-15 4:16:19 AM; Lifecycle Status: Active; Minimum Order: 1; Mounting Type: Through Hole; Packaging: Bulk; Part Status: Active; Price: 2.99; Series: Buchanan; Supplier 1: DigiKey; Supplier Part Number 1: A98336-ND
J2 = 282834-4: TERM BLK 4P SIDE ENT 2.54MM PCB; Manufacturer: TE Connectivity AMP Connectors; Current: 10A; Mating Orientation: Horizontal with Board; Number of Levels: 1; Pitch: 0.100" (2.54mm); Positions Per Level: 4; Voltage: 150V; Wire Gauge: 16-30 AWG; Wire Termination: Screw - Rising Cage Clamp; Part Number: 282834-4; Color: Green; ComponentLink1Description: Datasheet; ComponentLink1URL: https://www.te.com/commerce/DocumentDelivery/DDEController?Action=srchrtrv&DocNm=282834&DocType=Customer+Drawing&DocLang=English; ComponentLink2Description: DigiKey Link; ComponentLink2URL: http://digikey.com/product-detail/en/te-connectivity-amp-connectors/282834-4/A98335-ND/1153265; LastUpdated: 2020-01-15 4:16:05 AM; Lifecycle Status: Active; Minimum Order: 1; Mounting Type: Through Hole; Packaging: Bulk; Part Status: Active; Price: 2.68; Series: Buchanan; Supplier 1: DigiKey; Supplier Part Number 1: A98335-ND
R25 R26 = RMCF0603FT4K70: RES 4.7K OHM 1% 1/10W 0603; Manufacturer: Stackpole Electronics Inc; Value: 4.7 kOhms; Power (Watts): 0.1W, 1/10W; Temperature Coefficient: ±100ppm/°C; Part Number: RMCF0603FT4K70; ComponentLink1Description: Datasheet; ComponentLink1URL: https://www.seielect.com/catalog/sei-rmcf_rmcp.pdf; ComponentLink2Description: DigiKey Link; ComponentLink2URL: https://www.digikey.com/en/products/detail/stackpole-electronics-inc/RMCF0603FT4K70/1760998; Composition: Thick Film; Device Package: 0603 (1608 Metric); Features: Automotive AEC-Q200; Height - Seated (Max): 0.022" (0.55mm); LastUpdated: 2024-02-09 8:43:32 PM; Lifecycle Status: Active; Minimum Order: 1; Number of Terminations: 2; Operating Temperature: -55°C ~ 155°C; Package / Case: 0603 (1608 Metric); Packaging: CutTape; PartId: 6078; Part Status: Active; Price: 0.01; Ratings: AEC-Q200; Resistance: 4.7 kOhms; Series: RMCF; Size / Dimension: 0.061" L x 0.031" W (1.55mm x 0.80mm); Supplier 1: DigiKey; Supplier Part Number 1: RMCF0603FT4K70CT-ND; Supplier Device Package: 0603; Tolerance: ±1%
R27 R28 R35 = RT0603FRE0710KL: RES SMD 10K OHM 1% 1/10W 0603; Manufacturer: Yageo; Value: 10 kOhms; Power (Watts): 0.1W, 1/10W; Temperature Coefficient: ±50ppm/°C; Part Number: RT0603FRE0710KL; ComponentLink1Description: Datasheet; ComponentLink1URL: https://www.yageo.com/upload/media/product/productsearch/datasheet/rchip/PYu-RT_1-to-0.01_RoHS_L_11.pdf; ComponentLink2Description: DigiKey Link; ComponentLink2URL: https://www.digikey.com/en/products/detail/yageo/RT0603FRE0710KL/1075040; Composition: Thin Film; Device Package: 0603 (1608 Metric); Height - Seated (Max): 0.022" (0.55mm); LastUpdated: 2026-04-06 7:44:01 PM; Lifecycle Status: Active; Minimum Order: 1; Number of Terminations: 2; Operating Temperature: -55°C ~ 155°C; Package / Case: 0603 (1608 Metric); Packaging: TapeAndReel; PartId: 5671; Part Status: Active; Price: 0.01; Resistance: 10 kOhms; Series: RT; Size / Dimension: 0.063" L x 0.031" W (1.60mm x 0.80mm); Supplier 1: DigiKey; Supplier Part Number 1: YAG2321CT-ND; Supplier Device Package: 0603; Tolerance: ±1%
R29-R31 = RP73PF1J100RBTDF: RES SMD 100 OHM 0.1% 1/6W 0603; Manufacturer: TE Connectivity Passive Product; Power (Watts): 0.167W, 1/6W; Resistance: 100 Ohms; Temperature Coefficient: ±25ppm/°C; Part Number: RP73PF1J100RBTDF; Value: 100Ω; ComponentLink1Description: Datasheet; ComponentLink1URL: https://www.te.com/commerce/DocumentDelivery/DDEController?Action=srchrtrv&DocNm=1773272&DocType=DS&DocLang=English; ComponentLink2Description: DigiKey Link; ComponentLink2URL: https://www.digikey.com/en/products/detail/te-connectivity-passive-product/RP73PF1J100RBTDF/4033480; Composition: Thin Film; Device Package: 0603 (1608 Metric); Height - Seated (Max): 0.022" (0.55mm); LastUpdated: 2024-02-09 8:43:33 PM; Lifecycle Status: Active; Minimum Order: 1; Number of Terminations: 2; Operating Temperature: -55°C ~ 155°C; Package / Case: 0603 (1608 Metric); Packaging: TapeAndReel; PartId: 5814; Part Status: Active; Price: 0.14; Series: RP73, Holsworthy; Size / Dimension: 0.061" L x 0.031" W (1.55mm x 0.80mm); Supplier 1: DigiKey; Supplier Part Number 1: A110012CT-ND; Supplier Device Package: 0603; Tolerance: ±0.1%
R32 = CH0603-250RJNTA: RES 250 OHM 5% 1/8W 0603; Manufacturer: Vishay Sfernice; Power (Watts): 0.125W, 1/8W; Resistance: 250 Ohms; Temperature Coefficient: ±100ppm/°C; Part Number: CH0603-250RJNTA; Value: 250Ω; ComponentLink1Description: Datasheet; ComponentLink1URL: http://www.vishay.com/docs/53014/ch.pdf; ComponentLink2Description: DigiKey Link; ComponentLink2URL: https://www.digikey.com/en/products/detail/vishay-sfernice/CH0603-250RJNTA/9405751; Composition: Thin Film; Device Package: 0603 (1608 Metric); Features: RF, High Frequency; Height - Seated (Max): 0.025" (0.63mm); LastUpdated: 2024-02-09 8:43:16 PM; Lifecycle Status: Active; Minimum Order: 1; Number of Terminations: 2; Operating Temperature: -55°C ~ 155°C; Package / Case: 0603 (1608 Metric); Packaging: TapeAndReel; PartId: 10119; Part Status: Active; Price: 2.39; Series: CH; Size / Dimension: 0.060" L x 0.030" W (1.52mm x 0.76mm); Supplier 1: DigiKey; Supplier Part Number 1: 716-1168-1-ND; Supplier Device Package: 0603; Tolerance: ±5%
R33 R34 R36 R37 = CRCW06031K00FKEB: RES SMD 1K OHM 1% 1/10W 0603; Manufacturer: Vishay Dale; Power (Watts): 0.1W, 1/10W; Resistance: 1 kOhms; Temperature Coefficient: ±100ppm/°C; Part Number: CRCW06031K00FKEB; Value: 1kΩ; ComponentLink1Description: Datasheet; ComponentLink1URL: http://www.vishay.com/docs/20035/dcrcwe3.pdf; ComponentLink2Description: DigiKey Link; ComponentLink2URL: https://www.digikey.com/en/products/detail/vishay-dale/CRCW06031K00FKEB/5071169; Composition: Thick Film; Device Package: 0603 (1608 Metric); Features: Automotive AEC-Q200; Height - Seated (Max): 0.020" (0.50mm); LastUpdated: 2024-02-09 8:43:36 PM; Lifecycle Status: Active; Minimum Order: 1; Number of Terminations: 2; Operating Temperature: -55°C ~ 155°C; Package / Case: 0603 (1608 Metric); Packaging: CutTape; PartId: 5123; Part Status: Active; Price: 0.01; Ratings: AEC-Q200; Series: CRCW; Size / Dimension: 0.063" L x 0.033" W (1.60mm x 0.85mm); Supplier 1: DigiKey; Supplier Part Number 1: 541-2985-1-ND; Supplier Device Package: 0603; Tolerance: ±1%
U7 = CMP-0237-00215-3: ARM Cortex-M3 32-bit MCU, 64 KB Flash, 20 KB Internal RAM, 37 I/Os, 48-pin LQFP, -40 to 85 degC, Tray; Supply Voltage(Vcc) min (V): 2; Internal RAM Size (kB): 20; FLASH Size (Prog) (kB): 64; A/D Converter: 2x12-bit (10 Channel); I/Os (High Current): 37; Operating Frequency(F) (Processor speed) (MHz): 72; Core: ARM Cortex-M3; ComponentLink3Description: Package Specification; Mounting Technology: Surface Mount; PartNumber: STM32F103C8T6; PackageReference: LQFP48; Packing: Tray; ComponentLink3URL: http://www.st.com/st-web-ui/static/active/en/resource/technical/document/datasheet/DM00058181.pdf; DatasheetVersion: Rev. 16; ComponentLink1URL: http://www.st.com/web/en/home.html; PackageVersion: Rev. 6, 06/2013; ComponentLink2URL: http://www.st.com/st-web-ui/static/active/en/resource/technical/document/datasheet/CD00161566.pdf; ComponentLink1Description: Manufacturer URL; ComponentLink2Description: Datasheet; PackageDescription: 48-Pin Low Profile Quad Flat Package, 7 x 7 mm Body, 0.5 mm Pitch
U8 = CMP-0015-00070-3: as U1 on sheet PCL-01; Packaging: Tape and Reel; Min Operating Temperature: 0°C; REACH SVHC: No SVHC; Operating Supply Voltage: 18V; Package Quantity: 1; Number of Channels: 1; Number of Pins: 8; Number of Elements: 1; Lead Free: Lead Free; Gain Bandwidth Product: 600kHz; Nominal Gain Bandwidth Product: 600kHz; Unity Gain Bandwidth Product: 600kHz; Width: 3.91mm; Case/Package: D; Radiation Hardening: No; Input Offset Voltage (Vos): 150uV; Height: 1.58mm; Length: 4.9mm; Max Operating Temperature: 70°C; Number of Amplifiers: 1